# Altium schematic sheet Schematic.schdoc
size 225 x 216 mm
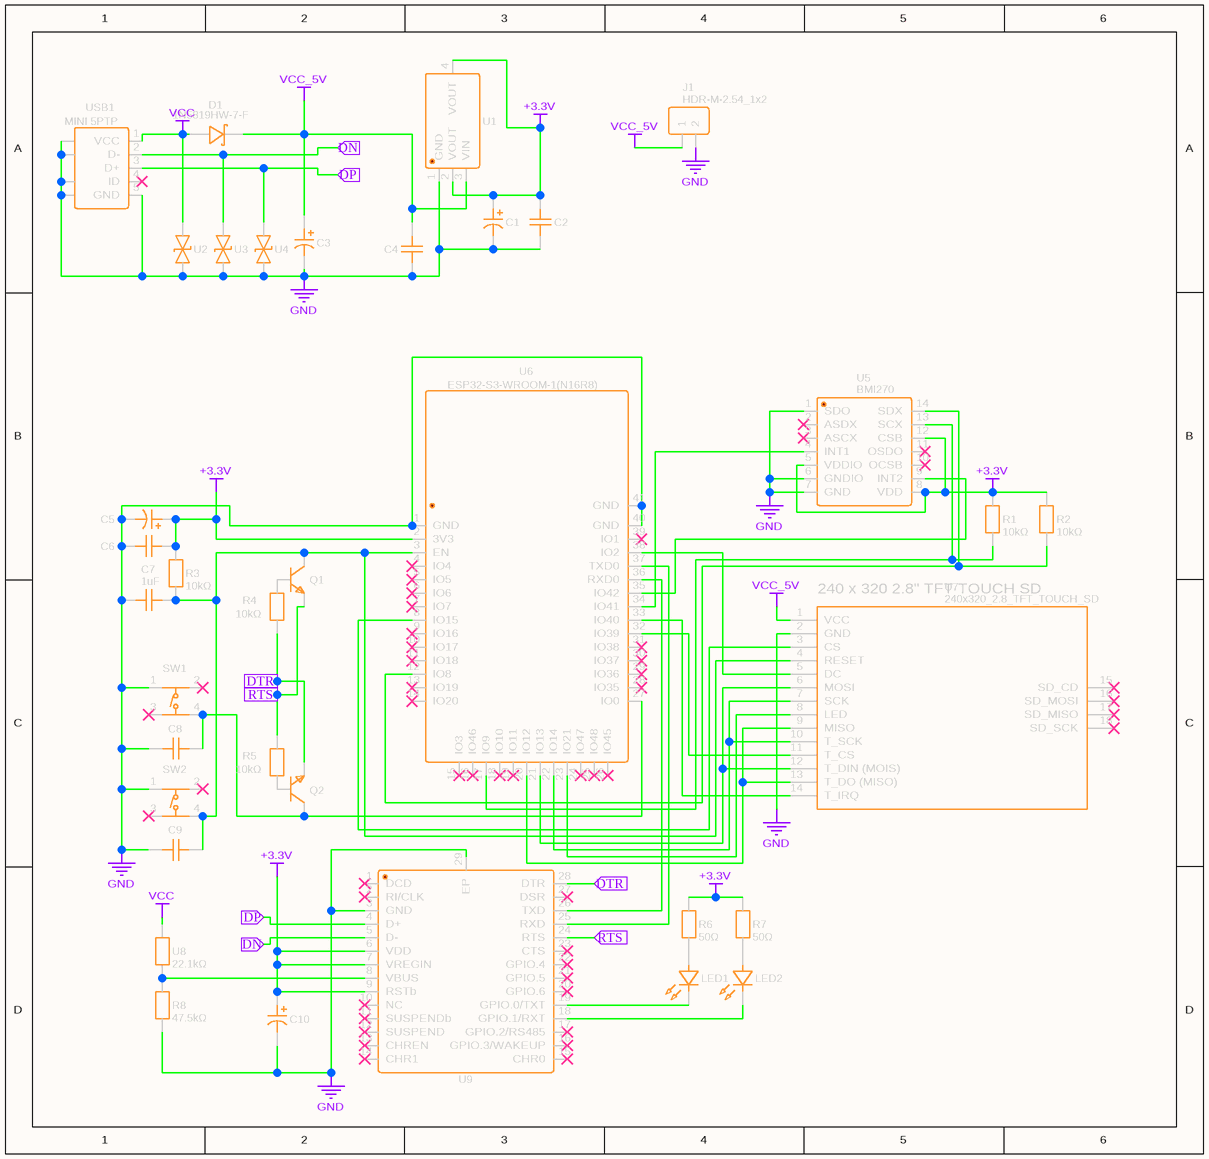
[diagram p0: Schematic.schdoc]

## Parts
C1  10uF  [CAP-SMD_BD4.0-L4.3-W4.3-FD-LS5.3]  (value not drawn)
C2  100nF  [CAP-TH_L5.8-W2.4-P2.54-D0.6]  (value not drawn)
C3  10uF  [CAP-SMD_BD4.0-L4.3-W4.3-FD-LS5.3]  (value not drawn)
C4  100nF  [CAP-TH_L5.8-W2.4-P2.54-D0.6]  (value not drawn)
C5  10uF  [CAP-SMD_BD4.0-L4.3-W4.3-FD-LS5.3]  (value not drawn)
C6  100nF  [CAP-TH_L5.8-W2.4-P2.54-D0.6]  (value not drawn)
C7  1uF  [CAP-TH_L5.8-W3.6-P5.0-D0.6]
C8  100nF  [CAP-TH_L5.8-W2.4-P2.54-D0.6]  (value not drawn)
C9  100nF  [CAP-TH_L5.8-W2.4-P2.54-D0.6]  (value not drawn)
C10  10uF  [CAP-SMD_BD4.0-L4.3-W4.3-FD-LS5.3]  (value not drawn)
D1  1N5819HW-7-F  [SOD-123_L2.7-W1.6-LS3.7-RD]
J1  HDR-M-2.54_1x2  [HDR-M-2.54_1X2]
LED1  15-21SURC/S530-A3/3T  [LED1206-R-RD_RED]  (value not drawn)
LED2  15-21SURC/S530-A3/3T  [LED1206-R-RD_RED]  (value not drawn)
Q1  L8050QLT1G  [SOT-23-3_L2.9-W1.3-P1.90-LS2.4-BR]  (value not drawn)
Q2  L8050QLT1G  [SOT-23-3_L2.9-W1.3-P1.90-LS2.4-BR]  (value not drawn)
R1  10kΩ  [RES-TH_BD4.5-L11.5-P15.50-D0.7]
R2  10kΩ  [RES-TH_BD4.5-L11.5-P15.50-D0.7]
R3  10kΩ  [RES-TH_BD4.5-L11.5-P15.50-D0.7]
R4  10kΩ  [RES-TH_BD4.5-L11.5-P15.50-D0.7]
R5  10kΩ  [RES-TH_BD4.5-L11.5-P15.50-D0.7]
R6  50Ω  [RES-TH_BD4.5-L11.0-P15.00-D0.7]
R7  50Ω  [RES-TH_BD4.5-L11.0-P15.00-D0.7]
R8  47.5kΩ  [RES-TH_BD3.3-L9.2-P13.20-D0.6]
SW1  LXW-TS-6X6X5-SMD  [SW-SMD_4P-L6.0-W6.0-P4.50-LS7.2]  (value not drawn)
SW2  LXW-TS-6X6X5-SMD  [SW-SMD_4P-L6.0-W6.0-P4.50-LS7.2]  (value not drawn)
U1  SGM2212-3.3XKC3G/TR_C3294699  [SOT-223-3_L6.5-W3.4-P2.30-LS7.0-BR]  (value not drawn)
U2  LESD5D5.0CT1G-ES  [SOD-523_L1.2-W0.8-LS1.6-BI]  (value not drawn)
U3  LESD5D5.0CT1G-ES  [SOD-523_L1.2-W0.8-LS1.6-BI]  (value not drawn)
U4  LESD5D5.0CT1G-ES  [SOD-523_L1.2-W0.8-LS1.6-BI]  (value not drawn)
U5  BMI270  [LGA-14_L3.0-W2.5-P0.50-BR]
U6  ESP32-S3-WROOM-1(N16R8)  [WIRELM-SMD_ESP32-S3-WROOM-1]
U7  240x320_2.8_TFT_TOUCH_SD  [240X320_2.8_TFT_TOUCH_SD]
U8  22.1kΩ  [RES-TH_BD2.3-L3.7-P7.70-D0.4]
U9  CP2102N-A02-GQFN28R  [QFN-28_L5.0-W5.0-P0.50-TL-EP3.3]  (value not drawn)
USB1  MINI 5PTP  [MINI-USB-SMD_MINI-5PTP]

## Ports
DN (in), DP (in), DTR (in), RTS (in)

## Nets
+3.3V: C1.1 C2.2 C5.1 C6.2 C10.1 R1.2 R2.2 R3.2 R6.2 R7.2 U1.2(VOUT) U1.4(VOUT) U5.5(VDDIO) U5.8(VDD) U5.12(CSB) U6.2(3V3) U9.6(VDD) U9.7(VREGIN) U9.9(RSTb)
GND: C1.2 C2.1 C3.2 C4.1 C5.2 C6.1 C7.2 C8.2 C9.1 C10.2 J1.2 R8.1 SW1.1 SW2.1 U1.1(GND) U2.2 U3.1 U4.1 U5.1(SDO) U5.6(GNDIO) U5.7(GND) U6.1(GND) U6.40(GND) U6.41(GND) U7.2(GND) U9.3(GND) U9.29(EP) USB1.5(GND) USB1.6(EH) USB1.7(EH) USB1.8(EH) USB1.9(EH)
VCC: D1.2(A) U2.1 U8.2 USB1.1(VCC)
VCC_5V: C3.1 C4.2 D1.1(K) J1.1 U1.3(VIN) U7.1(VCC)
DN: U3.2 U9.5(D-) USB1.2(D-) ; port DN
DP: U4.2 U9.4(D+) USB1.3(D+) ; port DP
DTR: Q2.2(E) R4.2 U9.28(DTR) ; port DTR
RTS: Q1.2(E) R5.2 U9.24(RTS) ; port RTS
NetC7_1: C7.1 C9.2 Q1.3(C) R3.1 SW2.4 U6.3(EN) U7.4(RESET)
NetC8_1: C8.1 Q2.3(C) SW1.4 U6.27(IO0)
NetLED1_1: LED1.1(A) R6.1
NetLED1_2: LED1.2(K) U9.19(GPIO.0/TXT)
NetLED2_1: LED2.1(A) R7.1
NetLED2_2: LED2.2(K) U9.18(GPIO.1/RXT)
NetQ1_1: Q1.1(B) R4.1
NetQ2_1: Q2.1(B) R5.1
NetR1_1: R1.1 U5.13(SCX) U6.17(IO9)
NetR2_1: R2.1 U5.14(SDX) U6.12(IO8)
NetR8_2: R8.2 U8.1 U9.8(VBUS)
NetU5_4: U5.4(INT1) U6.34(IO41)
NetU5_9: U5.9(INT2) U6.35(IO42)
NetU6_8: U6.8(IO15) U7.3(CS)
NetU6_20: U6.20(IO12) U7.9(MISO) U7.13(T_DO_(MISO))
NetU6_21: U6.21(IO13) U7.6(MOSI) U7.12(T_DIN_(MOIS))
NetU6_22: U6.22(IO14) U7.7(SCK) U7.10(T_SCK)
NetU6_23: U6.23(IO21) U7.8(LED)
NetU6_32: U6.32(IO39) U7.11(T_CS)
NetU6_33: U6.33(IO40) U7.14(T_IRQ)
NetU6_36: U6.36(RXD0) U9.26(TXD)
NetU6_37: U6.37(TXD0) U9.25(RXD)
NetU6_38: U6.38(IO2) U7.5(DC)

Not connected (* = marked no-connect by the designer): SW1 2* 3*; SW2 2* 3*; U5 2(ASDX)* 3(ASCX)* 10(OCSB)* 11(OSDO)*; U6 4(IO4)* 5(IO5)* 6(IO6)* 7(IO7)* 9(IO16)* 10(IO17)* 11(IO18)* 13(IO19)* 14(IO20)* 15(IO3)* 16(IO46)* 18(IO10)* 19(IO11)* 24(IO47)* 25(IO48)* 26(IO45)* 28(IO35)* 29(IO36)* 30(IO37)* 31(IO38)* 39(IO1)*; U7 15(SD_CD)* 16(SD_MOSI)* 17(SD_MISO)* 18(SD_SCK)*; U9 1(DCD)* 2(RI/CLK)* 10(NC)* 11(SUSPENDb)* 12(SUSPEND)* 13(CHREN)* 14(CHR1)* 15(CHR0)* 16(GPIO.3/WAKEUP)* 17(GPIO.2/RS485)* 20(GPIO.6)* 21(GPIO.5)* 22(GPIO.4)* 23(CTS)* 27(DSR)*; USB1 4(ID)*

## Notes on the sheet
- (in symbol 240x320_2.8_TFT_TOUCH_SD) 240 x 320 2.8" TFT TOUCH SD

## Library data of the parts
C1 C3 C5 C10 = 10uF: Manufacturer: FOLLON(富隆电子); Manufacturer Part: EFVH025ADA100M0454; nameAlias: Value; Contributor: lcsc; Supplier: LCSC; Supplier Part: C22387953; JLCPCB Part Class: Extended Part; spicePre: C; spiceSymbolName: EFVH025ADA100M0454
C2 C4 C6 C8 C9 = 100nF: Manufacturer: Dersonic(德尔创); Manufacturer Part: CC1H104ZA1ED3F5P1100; Contributor: LCSC; nameAlias: Value; Supplier: LCSC; Supplier Part: C2832506; JLCPCB Part Class: Extended Part; spicePre: C; spiceSymbolName: CC1H104ZA1ED3F5P1100
C7 = 1uF: Manufacturer: KNSCHA(科尼盛); Manufacturer Part: 178MU0005; nameAlias: Value; Contributor: lcsc; Supplier: LCSC; Supplier Part: C5632429; JLCPCB Part Class: Extended Part; spicePre: C; spiceSymbolName: 178MU0005
D1 = 1N5819HW-7-F: Manufacturer: DIODES(美台); Supplier: LCSC; Manufacturer Part: 1N5819HW-7-F; Supplier Part: C82544; JLCPCB Part Class: Extended Part; spicePre: D; spiceSymbolName: 1N5819HW-7-F
J1 = HDR-M-2.54_1x2: Contributor: LCEDA_Lib; Supplier Part: C124375; Supplier: LCSC; spicePre: J; spiceSymbolName: HDR-M-2.54_1x2
LED1 LED2 = 15-21SURC/S530-A3/3T: Manufacturer: EVERLIGHT(亿光); Contributor: lcsc; Supplier: LCSC; Supplier Part: C2984265; Manufacturer Part: 15-21SURC/S530-A3/3T; JLCPCB Part Class: Extended Part; spicePre: L; spiceSymbolName: 15-21SURC/S530-A3/3T
Q1 Q2 = L8050QLT1G: Manufacturer: LRC(乐山无线电); Supplier: LCSC; Manufacturer Part: L8050QLT1G; Supplier Part: C49581; JLCPCB Part Class: Extended Part; spicePre: Q; spiceSymbolName: L8050QLT1G
R1-R5 = 10kΩ: Manufacturer: 华星机电; Manufacturer Part: MF2WS-10KΩ±1%T; nameAlias: Value; Contributor: LCSC; Supplier: LCSC; Supplier Part: C714145; JLCPCB Part Class: Extended Part; spicePre: R; spiceSymbolName: MF2WS-10KΩ±1%T
R6 R7 = 50Ω: Manufacturer: RESI(开步睿思); Manufacturer Part: EWWR0001J50R0T9; nameAlias: Value; Contributor: lcsc; Supplier: LCSC; Supplier Part: C47116135; JLCPCB Part Class: Extended Part; spicePre: R; spiceSymbolName: EWWR0001J50R0T9
R8 = 47.5kΩ: Manufacturer: Tyohm(幸亚电阻); Manufacturer Part: RN1WS47.5KΩFT/BA1; nameAlias: Value; Contributor: LCSC; Supplier: LCSC; Supplier Part: C385390; JLCPCB Part Class: Extended Part; spicePre: R; spiceSymbolName: RN1WS47.5KΩFT/BA1
SW1 SW2 = LXW-TS-6X6X5-SMD: Manufacturer: LXWCONN(连兴旺电子); Contributor: lcsc; Supplier: LCSC; Supplier Part: C53447020; Manufacturer Part: LXW-TS-6X6X5-SMD; JLCPCB Part Class: Extended Part; spicePre: S; spiceSymbolName: LXW-TS-6X6X5-SMD
U1 = SGM2212-3.3XKC3G/TR_C3294699: Manufacturer: SGMICRO(圣邦微); Contributor: lcsc; Supplier: LCSC; Supplier Part: C3294699; Manufacturer Part: SGM2212-3.3XKC3G/TR; JLCPCB Part Class: Extended Part; spicePre: U; spiceSymbolName: SGM2212-3.3XKC3G/TR_C3294699
U2-U4 = LESD5D5.0CT1G-ES: Manufacturer: ElecSuper(静芯); Contributor: lcsc; Supplier: LCSC; Supplier Part: C5199159; Manufacturer Part: LESD5D5.0CT1G-ES; JLCPCB Part Class: Extended Part; spicePre: U; spiceSymbolName: LESD5D5.0CT1G-ES
U5 = BMI270: Manufacturer: Bosch(博世); Contributor: LCSC; Supplier: LCSC; Supplier Part: C2836813; Manufacturer Part: BMI270; JLCPCB Part Class: Extended Part; spicePre: U; spiceSymbolName: BMI270
U6 = ESP32-S3-WROOM-1(N16R8): Manufacturer: ESPRESSIF(乐鑫); Manufacturer Part: ESP32-S3-WROOM-1-N16R8; Contributor: lcsc; Supplier: LCSC; Supplier Part: C2913202; JLCPCB Part Class: Extended Part; spicePre: U; spiceSymbolName: ESP32-S3-WROOM-1(N16R8)
U7 = 240x320_2.8_TFT_TOUCH_SD: Contributor: KrisKasprzak; link: https://www.amazon.com/gp/product/B017FZTIO6/ref=ppx_yo_dt_b_search_asin_title?ie=UTF8&psc=1; spicePre: U; spiceSymbolName: 240x320_2.8_TFT_TOUCH_SD
U8 = 22.1kΩ: Manufacturer: VO(翔胜); Manufacturer Part: MF1/8W-22K1±1%-OT52; Contributor: lcsc; nameAlias: Value; Supplier: LCSC; Supplier Part: C2848551; JLCPCB Part Class: Extended Part; spicePre: U; spiceSymbolName: MF1/8W-22K1±1%-OT52
U9 = CP2102N-A02-GQFN28R: Manufacturer: SKYWORKS/SILICON LABS(芯科); Contributor: LCSC; Supplier: LCSC; Supplier Part: C964632; Manufacturer Part: CP2102N-A02-GQFN28R; JLCPCB Part Class: Extended Part; spicePre: U; spiceSymbolName: CP2102N-A02-GQFN28R
USB1 = MINI 5PTP: Manufacturer: SHOU HAN(首韩); Contributor: LCSC; Supplier: LCSC; Supplier Part: C2681563; Manufacturer Part: MINI 5PTP; JLCPCB Part Class: Extended Part; spicePre: U; spiceSymbolName: MINI 5PTP